# Altium schematic sheet Solenoid_Sheet.SchDoc
size 420 x 297 mm; SheetNumber: 4; SheetTotal: 5
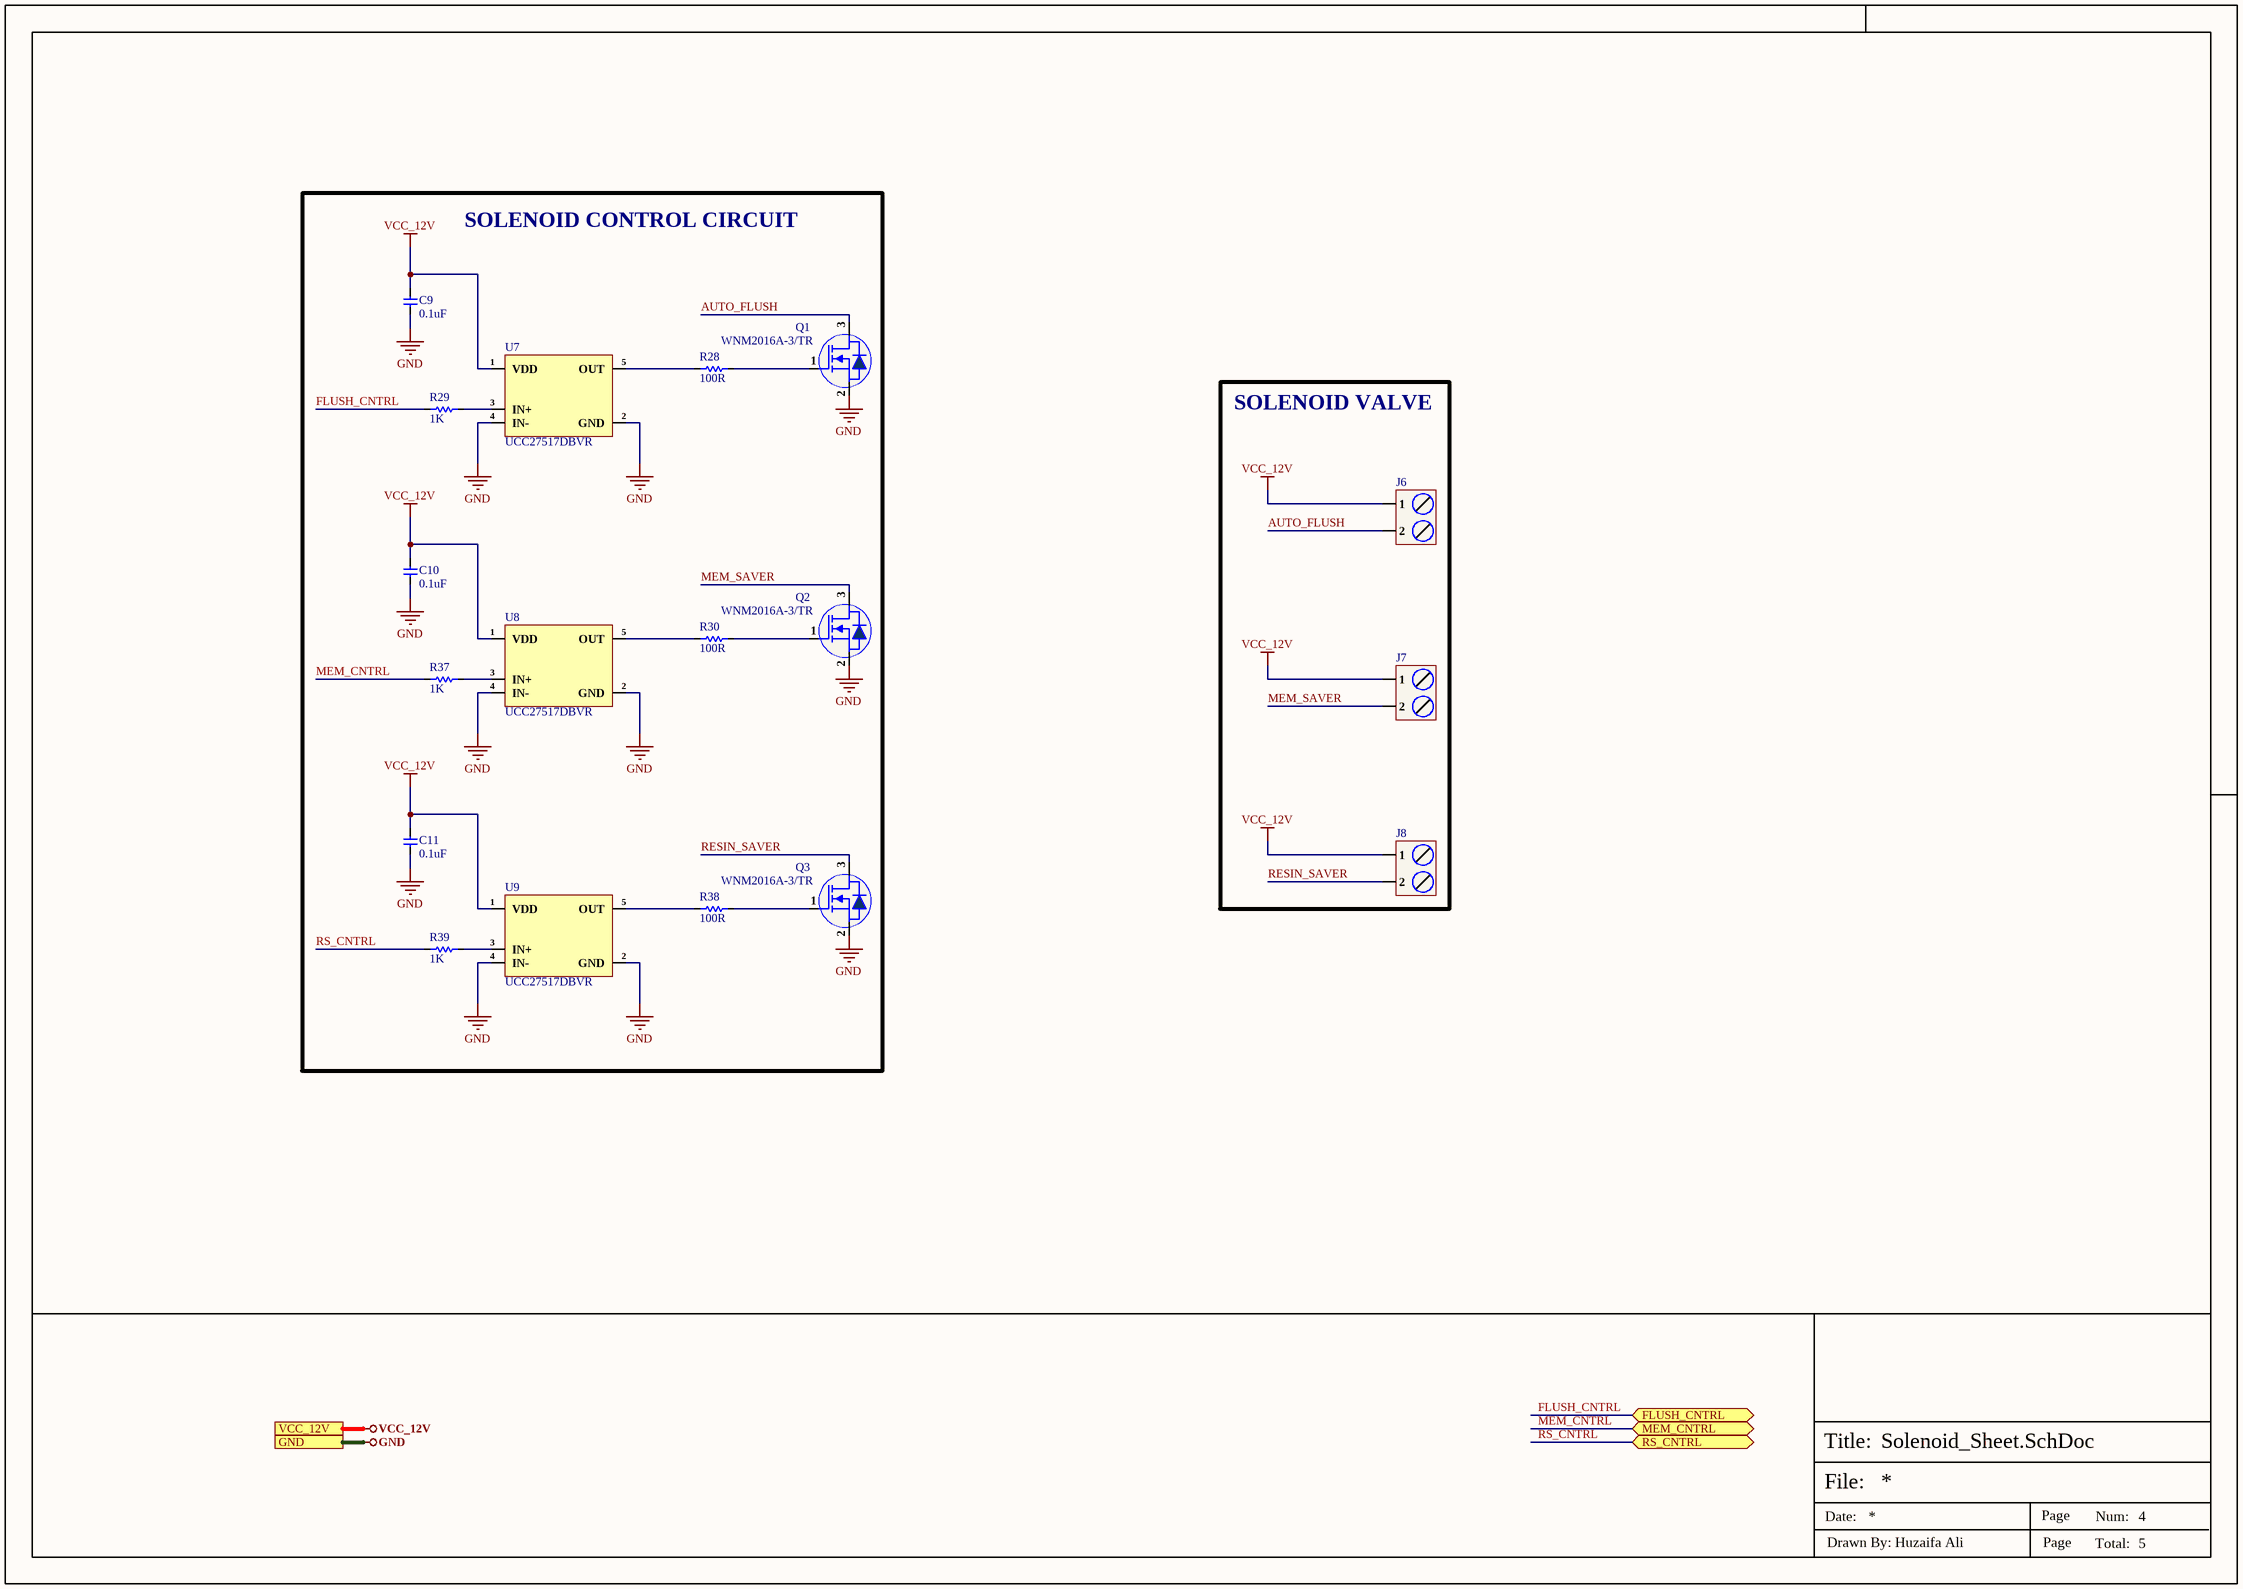
[diagram p0: Solenoid_Sheet.SchDoc]

## Parts
C9  0.1uF  [Cap-0402]
C10  0.1uF  [Cap-0402]
C11  0.1uF  [Cap-0402]
J6  TB008A-508-02BE  [TB008A-508-02BE]  (value not drawn)
J7  TB008A-508-02BE  [TB008A-508-02BE]  (value not drawn)
J8  TB008A-508-02BE  [TB008A-508-02BE]  (value not drawn)
Q1  WNM2016A-3/TR  [sot-23]
Q2  WNM2016A-3/TR  [sot-23]
Q3  WNM2016A-3/TR  [sot-23]
R28  100R  [RES-0603]
R29  1K  [Res-0402]
R30  100R  [RES-0603]
R37  1K  [Res-0402]
R38  100R  [RES-0603]
R39  1K  [Res-0402]
U7  UCC27517DBVR  [SOT-23-5]
U8  UCC27517DBVR  [SOT-23-5]
U9  UCC27517DBVR  [SOT-23-5]

## Blocks framed on the sheet
SOLENOID CONTROL CIRCUIT: C9-C11 Q1-Q3 R28-R30 R37-R39 U7-U9
SOLENOID VALVE: J6-J8

## Ports
FLUSH_CNTRL (bidir, see Top_Sheet[4B], Power_Sheet[5D]), GND (see Top_Sheet[5B], Flow_Pressure_Sheet[1D], Power_Sheet[1D], TDS_Temp_Sheet[1D]), MEM_CNTRL (bidir, see Top_Sheet[4B], Power_Sheet[5D]), RS_CNTRL (bidir, see Top_Sheet[4B], Power_Sheet[5D]), VCC_12V (see Top_Sheet[5B], Flow_Pressure_Sheet[1D], Power_Sheet[1D], TDS_Temp_Sheet[1D])

## Nets
GND: C9.1 C10.1 C11.1 Q1.2(S) Q2.2(S) Q3.2(S) U7.2(GND) U7.4(IN-) U8.2(GND) U8.4(IN-) U9.2(GND) U9.4(IN-) ; port GND
VCC_12V: C9.2 C10.2 C11.2 J6.1 J7.1 J8.1 U7.1(VDD) U8.1(VDD) U9.1(VDD) ; port VCC_12V
AUTO_FLUSH: J6.2 Q1.3(D)
FLUSH_CNTRL: R29.1 ; port FLUSH_CNTRL
MEM_CNTRL: R37.1 ; port MEM_CNTRL
MEM_SAVER: J7.2 Q2.3(D)
RESIN_SAVER: J8.2 Q3.3(D)
RS_CNTRL: R39.1 ; port RS_CNTRL
NetQ1_1: Q1.1(G) R28.2
NetQ2_1: Q2.1(G) R30.2
NetQ3_1: Q3.1(G) R38.2
NetR28_1: R28.1 U7.5(OUT)
NetR29_2: R29.2 U7.3(IN+)
NetR30_1: R30.1 U8.5(OUT)
NetR37_2: R37.2 U8.3(IN+)
NetR38_1: R38.1 U9.5(OUT)
NetR39_2: R39.2 U9.3(IN+)

## Notes on the sheet
- File:
- Title:
- Date:
- Page
- Num:
- Total:
- Drawn By: Huzaifa Ali

## Library data of the parts
C9-C11 = CC0402JRX7R7BB104: CAP CER 0.1UF 16V X7R 0402; Manufacturer: Yageo; Material: 4241ConductorMaterial; Value: 100nF; Tolerance: 5%; Item Type: Capacitor; Supplier: Digikey; Supplier Part Number: 311-1676-1-ND; Manufacturer Part Number: CC0402JRX7R7BB104; RoHS: Yes; Category: Ceramic Capacitors; Stock: 1659111; Pricing: 1=0.1, 10=0.046, 50=0.0262, 100=0.0203, 500=0.01528, 1000=0.012, 2500=0.01091, 5000=0.01004 (USD); Mounting Technology: Surface Mount; Case/Package: 0402; Case Code (Metric): 1005; Case Code (Imperial): 0402; Min Operating Temperature: -55°C; Max Operating Temperature: 125°C; Dielectric: X7R; Packaging: Tape and Reel; Package Quantity: 10000; Voltage Rating (DC): 16V; Voltage Rating: 16V; Series: CC; Construction: Flat; Length: 0.039inch; Width: 0.02inch; Height: 0.5mm; Thickness: 0.022inch; Lead Free: Lead Free; Halogen Free: Halogen Free; RoHS Compliant: Yes; ComponentLink1URL: https://datasheet.ciiva.com/13210/upy-gphc-x7r-6-3v-to-50v-8-12304-13210152.pdf?src-supplier=Mouser; ComponentLink1Description: https://datasheet.ciiva.com/13210/upy-gphc-x7r-6-3v-to-50v-8-12304-13210152.pdf?src-supplier=Mouser; LCSC Part Number: C541464
J6-J8 = TB008A-508-02BE: TERMINAL BLOCK, SCREW TYPE, 5.08; Manufacturer: Same Sky; Item Type: Terminal Blocks; Approvals: CE, IEC, UL, cUL; Current Rating: 16A; Number of Contacts: 2; Number of Levels: 1; Pitch: 5.08mm; Voltage Rating: 300V; Wire/Cable Gauge: 12AWG; Manufacturer Part Number: TB008A-508-02BE; RoHS: Compliant; Supplier: DigiKey; Supplier Part Number: 102-6213-ND; Stock: 2734; Pricing: 1=0.61, 10=0.451, 25=0.3932, 50=0.3542, 100=0.3198, 250=0.282, 500=0.25896, 1200=0.23595, 6000=0.20759 (USD); Color: Blue; Height: 15.82mm; Lifecycle Status: Production; Max Operating Temperature: 105°C; Min Operating Temperature: -40°C; Mounting Technology: Screw; Number of Rows: 1; Width: 13.89mm; ComponentLink1URL: https://datasheet.octopart.com:443/TB008A-508-02BE-Same-Sky-datasheet-181920260.pdf?src-supplier=Same+Sky; ComponentLink1Description: https://datasheet.octopart.com:443/TB008A-508-02BE-Same-Sky-datasheet-181920260.pdf?src-supplier=Same+Sky; ComponentLink2URL: https://datasheet.octopart.com:443/TB008A-508-02BE-CUI-Devices-datasheet-175928141.pdf?src-supplier=Same+Sky; ComponentLink2Description: https://datasheet.octopart.com:443/TB008A-508-02BE-CUI-Devices-datasheet-175928141.pdf?src-supplier=Same+Sky; ComponentLink3URL: https://datasheet.octopart.com:443/TB008A-508-02BE-CUI-Devices-datasheet-144794964.pdf?src-supplier=Same+Sky; ComponentLink3Description: https://datasheet.octopart.com:443/TB008A-508-02BE-CUI-Devices-datasheet-144794964.pdf?src-supplier=Same+Sky; ComponentLink4URL: https://datasheet.octopart.com:443/TB008A-508-02BE-CUI-Devices-datasheet-180438533.pdf?src-supplier=IHS; ComponentLink4Description: https://datasheet.octopart.com:443/TB008A-508-02BE-CUI-Devices-datasheet-180438533.pdf?src-supplier=IHS; ComponentLink5URL: https://datasheet.octopart.com:443/TB008A-508-02BE-Same-Sky-datasheet-182881448.pdf?src-supplier=Electro+Sonic; ComponentLink5Description: https://datasheet.octopart.com:443/TB008A-508-02BE-Same-Sky-datasheet-182881448.pdf?src-supplier=Electro+Sonic; ComponentLink6URL: https://datasheet.octopart.com:443/TB008A-508-02BE-CUI-Devices-datasheet-154730749.pdf?src-supplier=Electro+Sonic; ComponentLink6Description: https://datasheet.octopart.com:443/TB008A-508-02BE-CUI-Devices-datasheet-154730749.pdf?src-supplier=Electro+Sonic; ComponentLink7URL: https://datasheet.octopart.com:443/TB008A-508-02BE-CUI-Devices-datasheet-175927974.pdf?src-supplier=CUI+Devices+SCT; ComponentLink7Description: https://datasheet.octopart.com:443/TB008A-508-02BE-CUI-Devices-datasheet-175927974.pdf?src-supplier=CUI+Devices+SCT; ComponentLink8URL: https://datasheet.octopart.com:443/TB008A-508-02BE-CUI-Devices-datasheet-142371924.pdf?src-supplier=Future+Electronics; ComponentLink8Description: https://datasheet.octopart.com:443/TB008A-508-02BE-CUI-Devices-datasheet-142371924.pdf?src-supplier=Future+Electronics; ComponentLink9URL: https://datasheet.octopart.com:443/TB008A-508-02BE-Same-Sky-datasheet-182050257.pdf?src-supplier=Future+Electronics; ComponentLink9Description: https://datasheet.octopart.com:443/TB008A-508-02BE-Same-Sky-datasheet-182050257.pdf?src-supplier=Future+Electronics; ComponentLink10URL: https://datasheet.octopart.com:443/TB008A-508-02BE-CUI-Devices-datasheet-175928506.pdf?src-supplier=Future+Electronics; ComponentLink10Description: https://datasheet.octopart.com:443/TB008A-508-02BE-CUI-Devices-datasheet-175928506.pdf?src-supplier=Future+Electronics; ComponentLink11URL: https://datasheet.octopart.com:443/TB008A-508-02BE-CUI-Devices-datasheet-147843969.pdf?src-supplier=Future+Electronics; ComponentLink11Description: https://datasheet.octopart.com:443/TB008A-508-02BE-CUI-Devices-datasheet-147843969.pdf?src-supplier=Future+Electronics; ComponentLink12URL: https://octopart.com:443/opatz8j6/c1?t=70RcvCe5ZkRgGfEt3V6vu9Rs4fRjMXZXdN7o_jKjc1dIStjs0IdWQTWbo2m4XJFZN-ZP8jrAm8ZplrmsDRNZWu5vD1uRxoUEzG546i7xsfV2Hlacn1XvUR2XbUoQGro5ohP2MwvVjf8PoqdhdL5ostV4A3wznZJYIF3cjV4w5lqdbJSsZe_bWwCbg-0xN0VRUvfB1EMY8Vje3Eupa8s9ZFT71pkE5p7-eHFbrk2At8AAZTx0zaGgq3cGzzCo7b3plQZDv0g9EsQyQUqhBC4JyFJJTeTHRWNNhUkmN73PD8OCyLOPLnegennELhgJeyY7HD7r-bGsAjSnjBwQDgR4SNS6WopDa7PwSknd4UaR&src-supplier=Compliance+Statements; ComponentLink12Description: https://octopart.com:443/opatz8j6/c1?t=70RcvCe5ZkRgGfEt3V6vu9Rs4fRjMXZXdN7o_jKjc1dIStjs0IdWQTWbo2m4XJFZN-ZP8jrAm8ZplrmsDRNZWu5vD1uRxoUEzG546i7xsfV2Hlacn1XvUR2XbUoQGro5ohP2MwvVjf8PoqdhdL5ostV4A3wznZJYIF3cjV4w5lqdbJSsZe_bWwCbg-0xN0VRUvfB1EMY8Vje3Eupa8s9ZFT71pkE5p7-eHFbrk2At8AAZTx0zaGgq3cGzzCo7b3plQZDv0g9EsQyQUqhBC4JyFJJTeTHRWNNhUkmN73PD8OCyLOPLnegennELhgJeyY7HD7r-bGsAjSnjBwQDgR4SNS6WopDa7PwSknd4UaR&src-supplier=Compliance+Statements; ComponentLink13URL: https://octopart.com:443/opatz8j6/c1?t=Uo7J4IF8yNdenAOC46u8Tj87WKOsK2A7c2vs8Sa5WYpsHicIfMoXbTSbdSiyOVgpxAIJCnEdsRMUssp9co8EivZcQamcZCig1rv7D-Ug8PwU11654nZt9VBHHEO9J9O1TmTLkeOA50viz6XbUTUcFOxEIWFtOIpsQudSLNpXl0qwCRhM7cqCRnP2WYjdfnel41QgPMBd0OmGtB5n4xaHO6yfR0O84tGT4DFJu17jeSMsdcHZCnKlQJPS09wnjUoIgC30PVYN35xN_xndXGhnfduxGQWssTNdQ2Ew4lLPFXECETpUa_FU3_NIDCJhBmvudBKdEuF4t1En-YL9AhFUeE1LU0Iszw0AVyDT8Hn1nDsKYQ&src-supplier=Compliance+Statements; ComponentLink13Description: https://octopart.com:443/opatz8j6/c1?t=Uo7J4IF8yNdenAOC46u8Tj87WKOsK2A7c2vs8Sa5WYpsHicIfMoXbTSbdSiyOVgpxAIJCnEdsRMUssp9co8EivZcQamcZCig1rv7D-Ug8PwU11654nZt9VBHHEO9J9O1TmTLkeOA50viz6XbUTUcFOxEIWFtOIpsQudSLNpXl0qwCRhM7cqCRnP2WYjdfnel41QgPMBd0OmGtB5n4xaHO6yfR0O84tGT4DFJu17jeSMsdcHZCnKlQJPS09wnjUoIgC30PVYN35xN_xndXGhnfduxGQWssTNdQ2Ew4lLPFXECETpUa_FU3_NIDCJhBmvudBKdEuF4t1En-YL9AhFUeE1LU0Iszw0AVyDT8Hn1nDsKYQ&src-supplier=Compliance+Statements; ComponentLink14URL: https://octopart.com:443/opatz8j6/c1?t=QvKslLqyPFzau17NptgVLNRcuMhYIDBdCODdkHqrYmlyYaojLdNAUnoimpM8kJVdayLtCnbbKOALirt3kAy58b19LXjk0_7F41XvMIDT0eRXxnt9UHZUhX802G-ZzTsQIZnaFSbz4MEhjhtI2qswXHCzfmb8sqF0HXUhYlN6-rqlzfA-OyFj0jZaaAfm4-lvU9uPpsocCV1oKDEwT57xEscWeOARtAbVwqthJApLrBmKsw-5DWDhVMlxDbVvBXDO0fpzQdRNXWzvV5iRUvpPqWvudAW3YO1yLdtS--LwTFp95_TZ35xs_jHFthiTFDMmHALKuZGPmqbJgedvZH3Zk3g47VKlaCUtWvKEaHE3&src-supplier=Compliance+Statements; ComponentLink14Description: https://octopart.com:443/opatz8j6/c1?t=QvKslLqyPFzau17NptgVLNRcuMhYIDBdCODdkHqrYmlyYaojLdNAUnoimpM8kJVdayLtCnbbKOALirt3kAy58b19LXjk0_7F41XvMIDT0eRXxnt9UHZUhX802G-ZzTsQIZnaFSbz4MEhjhtI2qswXHCzfmb8sqF0HXUhYlN6-rqlzfA-OyFj0jZaaAfm4-lvU9uPpsocCV1oKDEwT57xEscWeOARtAbVwqthJApLrBmKsw-5DWDhVMlxDbVvBXDO0fpzQdRNXWzvV5iRUvpPqWvudAW3YO1yLdtS--LwTFp95_TZ35xs_jHFthiTFDMmHALKuZGPmqbJgedvZH3Zk3g47VKlaCUtWvKEaHE3&src-supplier=Compliance+Statements; ComponentLink15URL: https://octopart.com:443/opatz8j6/c1?t=vaYY41CogfnopSfDOPxoaqGeCdGNbbMVVihVh9piZThYC4z5UdzLQjuTDbTJQBTosCtHjK1U8s3WuliWmK31H20qTGz1dkr0vY7KPWk-lwdRYh6T0AVJBxjWCi0eVjFp9VnnwA-vZFto2L6_FJ-1JJOZC7c21m4C6LgLcEGoiZY5ivV0bdaUH14NZNWQcfXhucKYp6KsuPDjo6IvsvVydEIyl4r3dmRXALVohKm2RtfKZd3dTcnpmcifjmEzWhR-u4uu0vOGtKFb8OyaUtZ3gXgC8hliX2ctByKhLk-vsmWP8rGswQgdKk_F7i01fLK7QHLl5nXUFhOop_anT0dafluEmPu9S4IjVmRqgao-gzkWkw&src-supplier=Compliance+Statements; ComponentLink15Description: https://octopart.com:443/opatz8j6/c1?t=vaYY41CogfnopSfDOPxoaqGeCdGNbbMVVihVh9piZThYC4z5UdzLQjuTDbTJQBTosCtHjK1U8s3WuliWmK31H20qTGz1dkr0vY7KPWk-lwdRYh6T0AVJBxjWCi0eVjFp9VnnwA-vZFto2L6_FJ-1JJOZC7c21m4C6LgLcEGoiZY5ivV0bdaUH14NZNWQcfXhucKYp6KsuPDjo6IvsvVydEIyl4r3dmRXALVohKm2RtfKZd3dTcnpmcifjmEzWhR-u4uu0vOGtKFb8OyaUtZ3gXgC8hliX2ctByKhLk-vsmWP8rGswQgdKk_F7i01fLK7QHLl5nXUFhOop_anT0dafluEmPu9S4IjVmRqgao-gzkWkw&src-supplier=Compliance+Statements
Q1-Q3 = WNM2016A-3/TR: Single N-Channel, 20V, 4.7A, Power MOSFET; Manufacturer: WILLSEMI; Manufacturer Part Number: WNM2016A-3/TR; Footprint: SOT-23-3; ComponentLink1Description: LCSC; ComponentLink1URL: https://www.lcsc.com/product-detail/MOSFETs_WILLSEMI-Will-Semicon-WNM2016A-3-TR_C601105.html; LCSC Part Number: C601105; Item Type: Mosfet
R28 R30 R38 = RCA0603100RFKEAHP: RES SMD 100 OHM 1% 1/4W 0603; Manufacturer: Vishay Dale; Max Power Dissipation: 250mW; Temperature Coefficient: 100ppm/°C; Supplier 1: Digi-Key; Manufacturer Part Number: RCA0603100RFKEAHP; Stock 1: 0; Case/Package: 0603; Case Code (Imperial): 0603; Case Code (Metric): 1608; Min Operating Temperature: -55°C; Max Operating Temperature: 155°C; Resistor Type: Thick Film; Features: Automotive AEC-Q200,Anti-Sulfur; Packaging: Tape and Reel; Resistance: 100R; Tolerance: 1%; Number of Terminations: 2; RoHS Compliant: Yes; ComponentLink1URL: http://www.vishay.com/docs/20067/rcahp.pdf?src-supplier=Digi-Key; ComponentLink1Description: http://www.vishay.com/docs/20067/rcahp.pdf?src-supplier=Digi-Key; Supplier Part Number 1: 541-3244-2-ND; LCSC Part Number: C2074203
R29 R37 R39 = RC0402FR-071KL: RES 1K OHM 1% 1/16W 0402; Manufacturer: Yageo; Resistance: 1kR; Temperature Coefficient: 100ppm/°C; Voltage Rating (DC): 50V; Power Rating: 62.5mW; Max Power Dissipation: 63mW; Item Type: Resistor; Supplier 1: Avnet; Manufacturer Part Number: RC0402FR-071KL; RoHS: Yes; Category: Chip SMD Resistors; Stock 1: 13030000; Pricing 1: 10000=0.00085, 20000=0.00087, 40000=0.00084, 60000=0.00083, 80000=0.00079, 100000=0.00078, 1000000=0.00076 (USD); Case/Package: 0402; Number of Pins: 2; Case Code (Imperial): 0402; Case Code (Metric): 1005; Size Code: 0402; Min Operating Temperature: -55°C; Max Operating Temperature: 155°C; Resistor Type: Thick Film; Tolerance: 1%; Packaging: Tape and Reel; Voltage Rating: 50V; Termination: SMD/SMT; Features: Moisture Resistant; Series: RC; Number of Terminations: 2; Resistance Tolerance: 1%; Construction: Rectangular; Technology: THICK FILM; Length: 1mm; Width: 0.5mm; Height: 0.32mm; Depth: 0.5mm; Reach SVHC Compliant: Yes; Lead Free: Lead Free; RoHS Compliant: Yes; Military Standard: Not; ComponentLink1URL: https://datasheet.ciiva.com/11819/0900766b80c66297-11819477.pdf?src-supplier=RSComponents; ComponentLink1Description: https://datasheet.ciiva.com/11819/0900766b80c66297-11819477.pdf?src-supplier=RSComponents; ComponentLink2URL: https://datasheet.ciiva.com/7983/1018594-7983502.pdf?src-supplier=Element14; ComponentLink2Description: https://datasheet.ciiva.com/7983/1018594-7983502.pdf?src-supplier=Element14; ComponentLink3URL: https://datasheet.ciiva.com/22747/1018594-22747513.pdf?src-supplier=Element14; ComponentLink3Description: https://datasheet.ciiva.com/22747/1018594-22747513.pdf?src-supplier=Element14; ComponentLink4URL: https://datasheet.ciiva.com/12666/pyu-rc0402-51-rohs-l-6-r-12666741.pdf?src-supplier=Mouser; ComponentLink4Description: https://datasheet.ciiva.com/12666/pyu-rc0402-51-rohs-l-6-r-12666741.pdf?src-supplier=Mouser; ComponentLink5URL: https://datasheet.ciiva.com/7849/1018594-7849869.pdf?src-supplier=Element14; ComponentLink5Description: https://datasheet.ciiva.com/7849/1018594-7849869.pdf?src-supplier=Element14; ComponentLink6URL: https://datasheet.ciiva.com/7849/1018594-7849871.pdf?src-supplier=Element14; ComponentLink6Description: https://datasheet.ciiva.com/7849/1018594-7849871.pdf?src-supplier=Element14; ComponentLink7URL: https://datasheet.ciiva.com/17063/pyu-rc0402-51-rohs-l-6-r-17063193.pdf?src-supplier=Future+Electronics; ComponentLink7Description: https://datasheet.ciiva.com/17063/pyu-rc0402-51-rohs-l-6-r-17063193.pdf?src-supplier=Future+Electronics; Supplier Part Number 1: RC0402FR-071KL; LCSC Part Number: C106235
U7-U9 = UCC27517DBVR: IC GATE DRVR LOW-SIDE SOT23-5; Manufacturer: Texas Instruments; Operating Supply Voltage: 12V; Number of Outputs: 1; Max Supply Voltage: 18V; Min Supply Voltage: 4.5V; Rise Time: 22ns; Propagation Delay: 30ns; Output Current: 4A; Channel Type: Single; Fall Time: 11ns; Supplier: Mouser; LCSC Part Number: C99395; Manufacturer Part Number: UCC27517DBVR; RoHS: Yes; Item Type: IC; Stock: 71094; Pricing: 1=0.77, 10=0.646, 50=0.646, 100=0.501, 1000=0.346, 10000=0.29 (USD); Mounting Technology: Surface Mount; Case/Package: SOT-23-5; Pins: 5; Min Operating Temperature: -40°C; Max Operating Temperature: 140°C; Packaging: Tape and Reel; Package Quantity: 3000; Max Output current: 4A; Number of Drivers: 1; Turn-On Delay Time: 30ns; Number of Channels: 1; Series: -; Length: 2.9mm; Width: 1.6mm; Height: 1.45mm; Thickness: 1.2mm; Radiation Hardening: No; Lead Free: Lead Free; RoHS Compliant: Yes; ComponentLink1URL: http://components.arrow.com/part/dataview/52526194S5756N7713?src-supplier=Arrow+Electronics; ComponentLink1Description: http://components.arrow.com/part/dataview/52526194S5756N7713?src-supplier=Arrow+Electronics; ComponentLink2URL: http://www.ti.com/lit/ds/symlink/ucc27517.pdf?src-supplier=Avnet; ComponentLink2Description: http://www.ti.com/lit/ds/symlink/ucc27517.pdf?src-supplier=Avnet; ComponentLink3URL: http://www.ti.com/lit/ds/symlink/ucc27517.pdf?src-supplier=Digikey; ComponentLink3Description: http://www.ti.com/lit/ds/symlink/ucc27517.pdf?src-supplier=Digikey; ComponentLink4URL: http://www.ti.com/lit/gpn/ucc27517?src-supplier=Mouser; ComponentLink4Description: http://www.ti.com/lit/gpn/ucc27517?src-supplier=Mouser; ComponentLink5URL: http://www.ti.com/general/docs/lit/getliterature.tsp?genericPartNumber=UCC27516&&fileType=pdf&src-supplier=Avnet; ComponentLink5Description: http://www.ti.com/general/docs/lit/getliterature.tsp?genericPartNumber=UCC27516&&fileType=pdf&src-supplier=Avnet; ComponentLink6URL: https://www.verical.com/server-webapp/html/getDatasheet?partID=482756&src-supplier=Verical; ComponentLink6Description: https://www.verical.com/server-webapp/html/getDatasheet?partID=482756&src-supplier=Verical